# Altium schematic sheet AnalogProject_Schematic_file.SchDoc
size A4; SheetNumber: 1; SheetTotal: 1
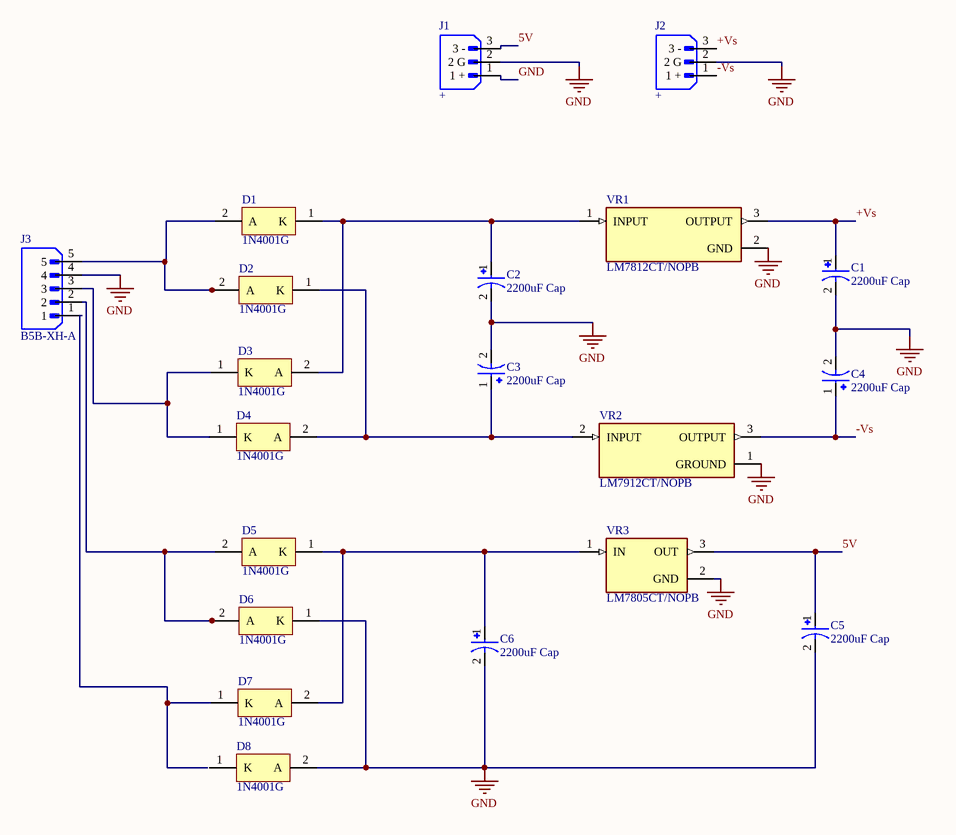
[diagram p0: AnalogProject_Schematic_file.SchDoc]

## Parts
C1  2200uF Cap  [2200uF Cap]
C2  2200uF Cap  [2200uF Cap]
C3  2200uF Cap  [2200uF Cap]
C4  2200uF Cap  [2200uF Cap]
C5  2200uF Cap  [2200uF Cap]
C6  2200uF Cap  [2200uF Cap]
D1  1N4001G  [1N4001_diode]
D2  1N4001G  [1N4001_diode]
D3  1N4001G  [1N4001_diode]
D4  1N4001G  [1N4001_diode]
D5  1N4001G  [1N4001_diode]
D6  1N4001G  [1N4001_diode]
D7  1N4001G  [1N4001_diode]
D8  1N4001G  [1N4001_diode]
J1  +  [JST_B3B-XH-A]
J2  +  [JST_B3B-XH-A]
J3  B5B-XH-A  [JST_B5B-XH-A]
VR1  LM7812CT/NOPB  [LM7812]
VR2  LM7912CT/NOPB  [LM7912]
VR3  LM7805CT/NOPB  [LM7805]

## Nets
GND: C1.2(N) C2.2(N) C3.2(N) C4.2(N) C5.2(N) C6.2(N) D6.1(K) D8.2(A) J1.1(1_+) J1.2(2_G) J2.2(2_G) J3.4 VR1.2(GND) VR2.1(GROUND) VR3.2(GND)
5V: C5.1(P) J1.3(3_-) VR3.3(OUT)
+Vs: C1.1(P) J2.3(3_-) VR1.3(OUTPUT)
-Vs: C4.1(P) J2.1(1_+) VR2.3(OUTPUT)
NetC2_1: C2.1(P) D1.1(K) D3.2(A) VR1.1(INPUT)
NetC3_1: C3.1(P) D2.1(K) D4.2(A) VR2.2(INPUT)
NetC6_1: C6.1(P) D5.1(K) D7.2(A) VR3.1(IN)
NetD1_2: D1.2(A) D2.2(A) J3.5
NetD3_1: D3.1(K) D4.1(K) J3.3
NetD5_2: D5.2(A) D6.2(A) J3.2
NetD7_1: D7.1(K) J3.1

Not connected (* = marked no-connect by the designer): D8 1(K)

## Library data of the parts
C1-C6 = 2200uF Cap: 2200 ÂµF 25 V Aluminum Electrolytic Capacitors Radial, Can - 5000 Hrs @ 105Â°C; MP: EEUFC1E222; MF: Panasonic; Check_prices: https://www.snapeda.com/parts/EEUFC1E222/Panasonic/view-part/?ref=eda; Availability: In Stock; Price: None; Package: RADIAL-2 Panasonic; Value: *; SnapEDA_Link: https://www.snapeda.com/parts/EEUFC1E222/Panasonic/view-part/?ref=snap
D1-D8 = CMP-0902-00120-1: Diode, Rectifier, Standard, Vr 50V, If 1A, Pkg SOD57, Vf 0.93V, Tj +175C, Cs 30A, Ir 1UA; Manufacturer: On Semiconductor; Manufacturer Lifecycle Status: ACTIVE; Packing: Bulk Bag; IFSM Max (A): 30; Type: Standard Recovery; VRRM Max (V): 50; IO(rec) Max (A): 1; Element Configuration: Single; Forward Voltage: 1.1V; Peak Reverse Current: 10µA; RoHS: TRUE; DatasheetVersion: Rev. 13; ComponentLink2URL: http://www.onsemi.com/pub_link/Collateral/1N4001-D.PDF; PackageDescription: 2-Pin, Axial Lead, Diameter 2.35 mm; PackageReference: AXIAL_LEAD-2-59-10; ComponentLink3Description: Package Specification; ComponentLink2Description: Datasheet; ComponentLink1Description: Manufacturer URL; Mounting Technology: Through Hole; ComponentLink1URL: http://www.onsemi.com/; PartNumber: 1N4001G; PackageVersion: Rev. U, 02/2005; ComponentLink3URL: http://www.onsemi.cn/pub_link/Collateral/59-10.PDF; Supplier: DigiKey; Supplier Part Number: 1N4001GOS-ND; Manufacturer Part Number: 1N4001G; Category: Rectifier Diodes; Stock: 18819; Pricing: 1=0.17, 10=0.11, 100=0.0958, 500=0.0703, 1000=0.05028, 2000=0.04862, 5000=0.04638, 10000=0.04282, 50000=0.03549 (USD); Average Rectified Current: 1A; Breakdown Voltage: 50V; China RoHS: Non-Compliant; Contact Plating: Tin; Current Rating: 1A; Diameter: 2.7mm; Forward Current: 1A; Halogen Free: Halogen Free; Height: 5.2mm; Lead Free: Lead Free; Length: 5.1816mm; Lifecycle Status: Production; Max Forward Surge Current (Ifsm): 30A; Max Operating Temperature: 150°C; Max Output current: 1A; Max Repetitive Reverse Voltage (Vrrm): 50V; Max Reverse Voltage (DC): 50V; Max Surge Current: 30A; Min Operating Temperature: -65°C; Number of Elements: 1; Pins: 2; Number of Terminals: 2; Output Current: 1A; Packaging: Bulk; Peak Non-Repetitive Surge Current: 30A; Polarity: Standard; Radiation Hardening: No; REACH SVHC: No; Reverse Standoff Voltage: 50V; Reverse Voltage: 50V; Schedule B: 8541100080, 8541100080|8541100080, 8541100080|8541100080|8541100080, 8541100080|8541100080|8541100080|8541100080; Voltage Rating (DC): 50V; Weight: 4.535924g; Width: 6.35mm; ComponentLink4URL: https://datasheet.octopart.com:443/1N4001G-onsemi-datasheet-180957166.pdf?src-supplier=IHS; ComponentLink4Description: https://datasheet.octopart.com:443/1N4001G-onsemi-datasheet-180957166.pdf?src-supplier=IHS; ComponentLink5URL: https://datasheet.octopart.com:443/1N4001G-ON-Semiconductor-datasheet-12530915.pdf?src-supplier=TME; ComponentLink5Description: https://datasheet.octopart.com:443/1N4001G-ON-Semiconductor-datasheet-12530915.pdf?src-supplier=TME; ComponentLink6URL: https://datasheet.octopart.com:443/1N4001G-ON-Semiconductor-datasheet-642969.pdf?src-supplier=Newark; ComponentLink6Description: https://datasheet.octopart.com:443/1N4001G-ON-Semiconductor-datasheet-642969.pdf?src-supplier=Newark; ComponentLink7URL: https://datasheet.octopart.com:443/1N4001G-ON-Semiconductor-datasheet-120079161.pdf?src-supplier=Electro+Sonic; ComponentLink7Description: https://datasheet.octopart.com:443/1N4001G-ON-Semiconductor-datasheet-120079161.pdf?src-supplier=Electro+Sonic; ComponentLink8URL: https://datasheet.octopart.com:443/1N4001G-onsemi-datasheet-169408229.pdf?src-supplier=Farnell; ComponentLink8Description: https://datasheet.octopart.com:443/1N4001G-onsemi-datasheet-169408229.pdf?src-supplier=Farnell; ComponentLink9URL: https://datasheet.octopart.com:443/1N4001G-ON-Semiconductor-datasheet-7627526.pdf?src-supplier=Farnell; ComponentLink9Description: https://datasheet.octopart.com:443/1N4001G-ON-Semiconductor-datasheet-7627526.pdf?src-supplier=Farnell; ComponentLink10URL: https://datasheet.octopart.com:443/1N4001G-onsemi-datasheet-189127465.pdf?src-supplier=Master+Electronics; ComponentLink10Description: https://datasheet.octopart.com:443/1N4001G-onsemi-datasheet-189127465.pdf?src-supplier=Master+Electronics; ComponentLink11URL: https://datasheet.octopart.com:443/1N4001G-ON-Semiconductor-datasheet-9575991.pdf?src-supplier=RS+(Formerly+Allied+Electronics); ComponentLink11Description: https://datasheet.octopart.com:443/1N4001G-ON-Semiconductor-datasheet-9575991.pdf?src-supplier=RS+(Formerly+Allied+Electronics); ComponentLink12URL: https://datasheet.octopart.com:443/1N4001G-ON-Semiconductor-datasheet-14055278.pdf?src-supplier=iiiC; ComponentLink12Description: https://datasheet.octopart.com:443/1N4001G-ON-Semiconductor-datasheet-14055278.pdf?src-supplier=iiiC; ComponentLink13URL: http://sigma.octopart.com:80/15540786/rohs_certificate/ON-Semiconductor-1N4001G.pdf?src-supplier=Compliance+Statements; ComponentLink13Description: http://sigma.octopart.com:80/15540786/rohs_certificate/ON-Semiconductor-1N4001G.pdf?src-supplier=Compliance+Statements; ComponentLink14URL: http://sigma.octopart.com:80/15672877/materials_sheet/ON-Semiconductor-1N4001G.csv?src-supplier=Compliance+Statements; ComponentLink14Description: http://sigma.octopart.com:80/15672877/materials_sheet/ON-Semiconductor-1N4001G.csv?src-supplier=Compliance+Statements; ComponentLink15URL: http://sigma.octopart.com:80/150599183/rohs_statement/ON-Semiconductor-1N4001G.pdf?src-supplier=Compliance+Statements; ComponentLink15Description: http://sigma.octopart.com:80/150599183/rohs_statement/ON-Semiconductor-1N4001G.pdf?src-supplier=Compliance+Statements; ComponentLink16URL: http://sigma.octopart.com:80/reach_statement/ON-Semiconductor-company-79.pdf?src-supplier=Compliance+Statements; ComponentLink16Description: http://sigma.octopart.com:80/reach_statement/ON-Semiconductor-company-79.pdf?src-supplier=Compliance+Statements; ComponentLink17URL: http://sigma.octopart.com:80/reach_statement/Fairchild-Semiconductor-company-9.pdf?src-supplier=Compliance+Statements; ComponentLink17Description: http://sigma.octopart.com:80/reach_statement/Fairchild-Semiconductor-company-9.pdf?src-supplier=Compliance+Statements; ComponentLink18URL: http://sigma.octopart.com:80/rohs_statement/Fairchild-Semiconductor-company-10.pdf?src-supplier=Compliance+Statements; ComponentLink18Description: http://sigma.octopart.com:80/rohs_statement/Fairchild-Semiconductor-company-10.pdf?src-supplier=Compliance+Statements; ComponentLink19URL: http://sigma.octopart.com:80/rohs_statement/Fairchild-Semiconductor-company-11.pdf?src-supplier=Compliance+Statements; ComponentLink19Description: http://sigma.octopart.com:80/rohs_statement/Fairchild-Semiconductor-company-11.pdf?src-supplier=Compliance+Statements; ComponentLink20URL: https://octopart.com:443/opatz8j6/c1?t=Btc9yGr2Y6o3Pwa-u9IBNKBFOyXQsxSPzEp4tg1RnPN713PaLfwQ1VfuA_XWUtxZRoPEkwrRKtNU5uHmE9a_mhTqVQTtSywZFs8RaIGslnhFNPFr0p--yrxVyK_45oNWJt5JSFmwDU9d0CfUqhMTwTunA-l-EiNiIFdD3010omeyugU4VABW7IUkzIZBO9zKDN8M65PIbE-UaUrn33F7C4G05qz9fywyIsOWlUx2CANabjtnz7BcYWIZxYz_gNHThvESJfauwUU2t5ONFD2VpZoaqptG4I_ZAR9eGyvho77mnZZKzNh8uTO_hCoLFf0wHUbJxZDoQtu7_HsXZHzHAZZSUEaf&src-supplier=Compliance+Statements; ComponentLink20Description: https://octopart.com:443/opatz8j6/c1?t=Btc9yGr2Y6o3Pwa-u9IBNKBFOyXQsxSPzEp4tg1RnPN713PaLfwQ1VfuA_XWUtxZRoPEkwrRKtNU5uHmE9a_mhTqVQTtSywZFs8RaIGslnhFNPFr0p--yrxVyK_45oNWJt5JSFmwDU9d0CfUqhMTwTunA-l-EiNiIFdD3010omeyugU4VABW7IUkzIZBO9zKDN8M65PIbE-UaUrn33F7C4G05qz9fywyIsOWlUx2CANabjtnz7BcYWIZxYz_gNHThvESJfauwUU2t5ONFD2VpZoaqptG4I_ZAR9eGyvho77mnZZKzNh8uTO_hCoLFf0wHUbJxZDoQtu7_HsXZHzHAZZSUEaf&src-supplier=Compliance+Statements; ComponentLink21URL: https://octopart.com:443/opatz8j6/c1?t=ZzknCHRg1eQ0pBumD0smVZiDD7l0WIJxyB-GReAyKIHHXvCoGAl7N6KvvitfTZ_kS-BuwgVwGktFAqT5Etjfm8z2MrpD0Fv5hVeeNCfyR7K2vu65XlwxpbxnTacAWLjZtMJFE1XAOFuxxtViVIl_jxY3RjVJGecmGYptHNuJW5NI0GyIxNheSVEtQFEenhuBhf59cl8P4cyOuCw4Pf1ydSMw8_ZXmVQ88EklmMBxhbsjO7mxbuhQFU_aFJa2MGHq9Eu8gG2EezbstrSIdlyA2U2Z4qw-72lL76f98V4UigxNRMaaLpiadmiStbOc-D-VGSnr_fOP9dgx445bnGN4BWdDdQZTGA&src-supplier=Compliance+Statements; ComponentLink21Description: https://octopart.com:443/opatz8j6/c1?t=ZzknCHRg1eQ0pBumD0smVZiDD7l0WIJxyB-GReAyKIHHXvCoGAl7N6KvvitfTZ_kS-BuwgVwGktFAqT5Etjfm8z2MrpD0Fv5hVeeNCfyR7K2vu65XlwxpbxnTacAWLjZtMJFE1XAOFuxxtViVIl_jxY3RjVJGecmGYptHNuJW5NI0GyIxNheSVEtQFEenhuBhf59cl8P4cyOuCw4Pf1ydSMw8_ZXmVQ88EklmMBxhbsjO7mxbuhQFU_aFJa2MGHq9Eu8gG2EezbstrSIdlyA2U2Z4qw-72lL76f98V4UigxNRMaaLpiadmiStbOc-D-VGSnr_fOP9dgx445bnGN4BWdDdQZTGA&src-supplier=Compliance+Statements
J1 J2 = B3B-XH-A: Connector Header Through Hole 3 position 0.098 (2.50mm); MF: JST Sales; SnapEDA_Link: https://www.snapeda.com/parts/B3B-XH-A/JST+Sales+America+Inc./view-part/?ref=snap; Package: None; Value: *; MP: B3B-XH-A; Check_prices: https://www.snapeda.com/parts/B3B-XH-A/JST+Sales+America+Inc./view-part/?ref=eda
J3 = B5B-XH-A: Connector Header Through Hole 5 position 0.098 (2.50mm); MF: JST Sales; SnapEDA_Link: https://www.snapeda.com/parts/B5B-XH-A/JST+Sales+America+Inc./view-part/?ref=snap; Package: None; Value: *; MP: B5B-XH-A; Check_prices: https://www.snapeda.com/parts/B5B-XH-A/JST+Sales+America+Inc./view-part/?ref=eda
VR1 = LM7812CT/NOPB: 1.5-A, 30-V, linear voltage regulator; MF: Texas Instruments; SnapEDA_Link: https://www.snapeda.com/parts/LM7812CT/NOPB/Texas+Instruments/view-part/?ref=snap; Package: TO-220-3 Texas Instruments; Value: *; MP: LM7812CT/NOPB; Check_prices: https://www.snapeda.com/parts/LM7812CT/NOPB/Texas+Instruments/view-part/?ref=eda
VR2 = LM7912CT/NOPB: 1.5-A, negative linear voltage regulator; MF: Texas Instruments; SnapEDA_Link: https://www.snapeda.com/parts/LM7912CT/NOPB/Texas+Instruments/view-part/?ref=snap; Package: TO-220-3 Texas Instruments; Value: *; MP: LM7912CT/NOPB; Check_prices: https://www.snapeda.com/parts/LM7912CT/NOPB/Texas+Instruments/view-part/?ref=eda
VR3 = LM7805CT/NOPB: Linear Voltage Regulator IC Positive Fixed 1 Output 1.5A TO-220-3; MF: ON Semiconductor; Purchase-URL: https://pricing.snapeda.com/search/part/LM7805CT/?ref=eda; Check_prices: https://www.snapeda.com/parts/LM7805CT/Onsemi/view-part/?ref=eda; SnapEDA_Link: https://www.snapeda.com/parts/LM7805CT/Onsemi/view-part/?ref=snap; Price: None; Availability: In Stock; Package: TO-220-3 ON Semiconductor; MP: LM7805CT; Value: *